# Altium schematic sheet accelerator.SchDoc
size A4; SheetNumber: 4; SheetTotal: 8
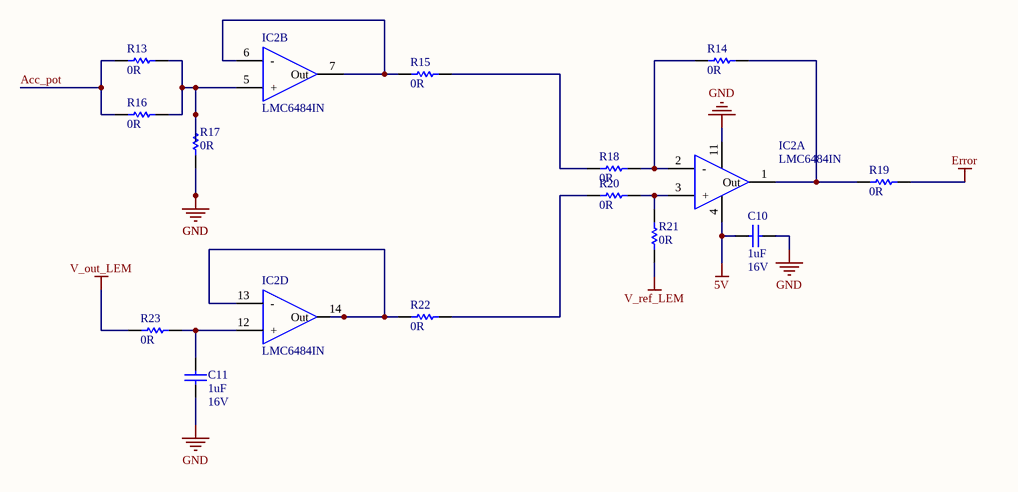
[diagram p0: accelerator.SchDoc]

## Parts
C10  Max Voltage: 16V  [CAPC1608L]  (hidden comment: 1uF)
C11  Max Voltage: 16V  [CAPC1608L]  (hidden comment: 1uF)
IC2  LMC6484IN  [DIP794W56P254L1905H533Q14N]  (parts A,B,D of 4)
R13  0R  [RESC1608L]
R14  0R  [RESC1608L]
R15  0R  [RESC1608L]
R16  0R  [RESC1608L]
R17  0R  [RESC1608L]
R18  0R  [RESC1608L]
R19  0R  [RESC1608L]
R20  0R  [RESC1608L]
R21  0R  [RESC1608L]
R22  0R  [RESC1608L]
R23  0R  [RESC1608L]

## Nets
5V: C10.2 IC2.4(Vcc)
Error: R19.1
GND: C10.1 C11.1 IC2.11(-Vcc) R17.2
V_out_LEM: R23.1
V_ref_LEM: R21.2
Acc_pot: R13.1 R16.1
NetC11_2: C11.2 IC2.12(+) R23.2
NetIC2_1: IC2.1(Out) R14.1 R19.2
NetIC2_2: IC2.2(-) R14.2 R18.1
NetIC2_3: IC2.3(+) R20.1 R21.1
NetIC2_5: IC2.5(+) R13.2 R16.2 R17.1
NetIC2_6: IC2.6(-) IC2.7(Out) R15.2
NetIC2_13: IC2.13(-) IC2.14(Out) R22.2
NetR15_1: R15.1 R18.2
NetR20_2: R20.2 R22.1

## Library data of the parts
C10 C11 = CC_1uF_0603: CAP CER 1uF Y5V -20% +80% 16V 0603; PackageReference: 0603; Code_IPC: 1608 [0603]; Verify: *; Supplier: ECE Dept; Storage Location: PCB Assembly WS; Value: 1uF
IC2 = LMC6484IN: Integrated Circuit; Manufacturer_Name: Texas Instruments; Datasheet Link: http://www.ti.com/lit/gpn/lmc6484; Height: 5.334mm; Manufacturer_Part_Number: LMC6484IN; Arrow Part Number: LMC6484IN; Mouser Part Number: 926-LMC6484IN; Mouser Price/Stock: https://www.mouser.com/Search/Refine.aspx?Keyword=926-LMC6484IN
R13-R23 = RS_0R0: RES 0.0 OHM 1/10W 5% 0603 SMD; Storage Location: PCB Assembly WS; Supplier: ECE Dept; Value: 0R